# Altium schematic sheet 03_Sensors.SchDoc
size 406 x 279 mm
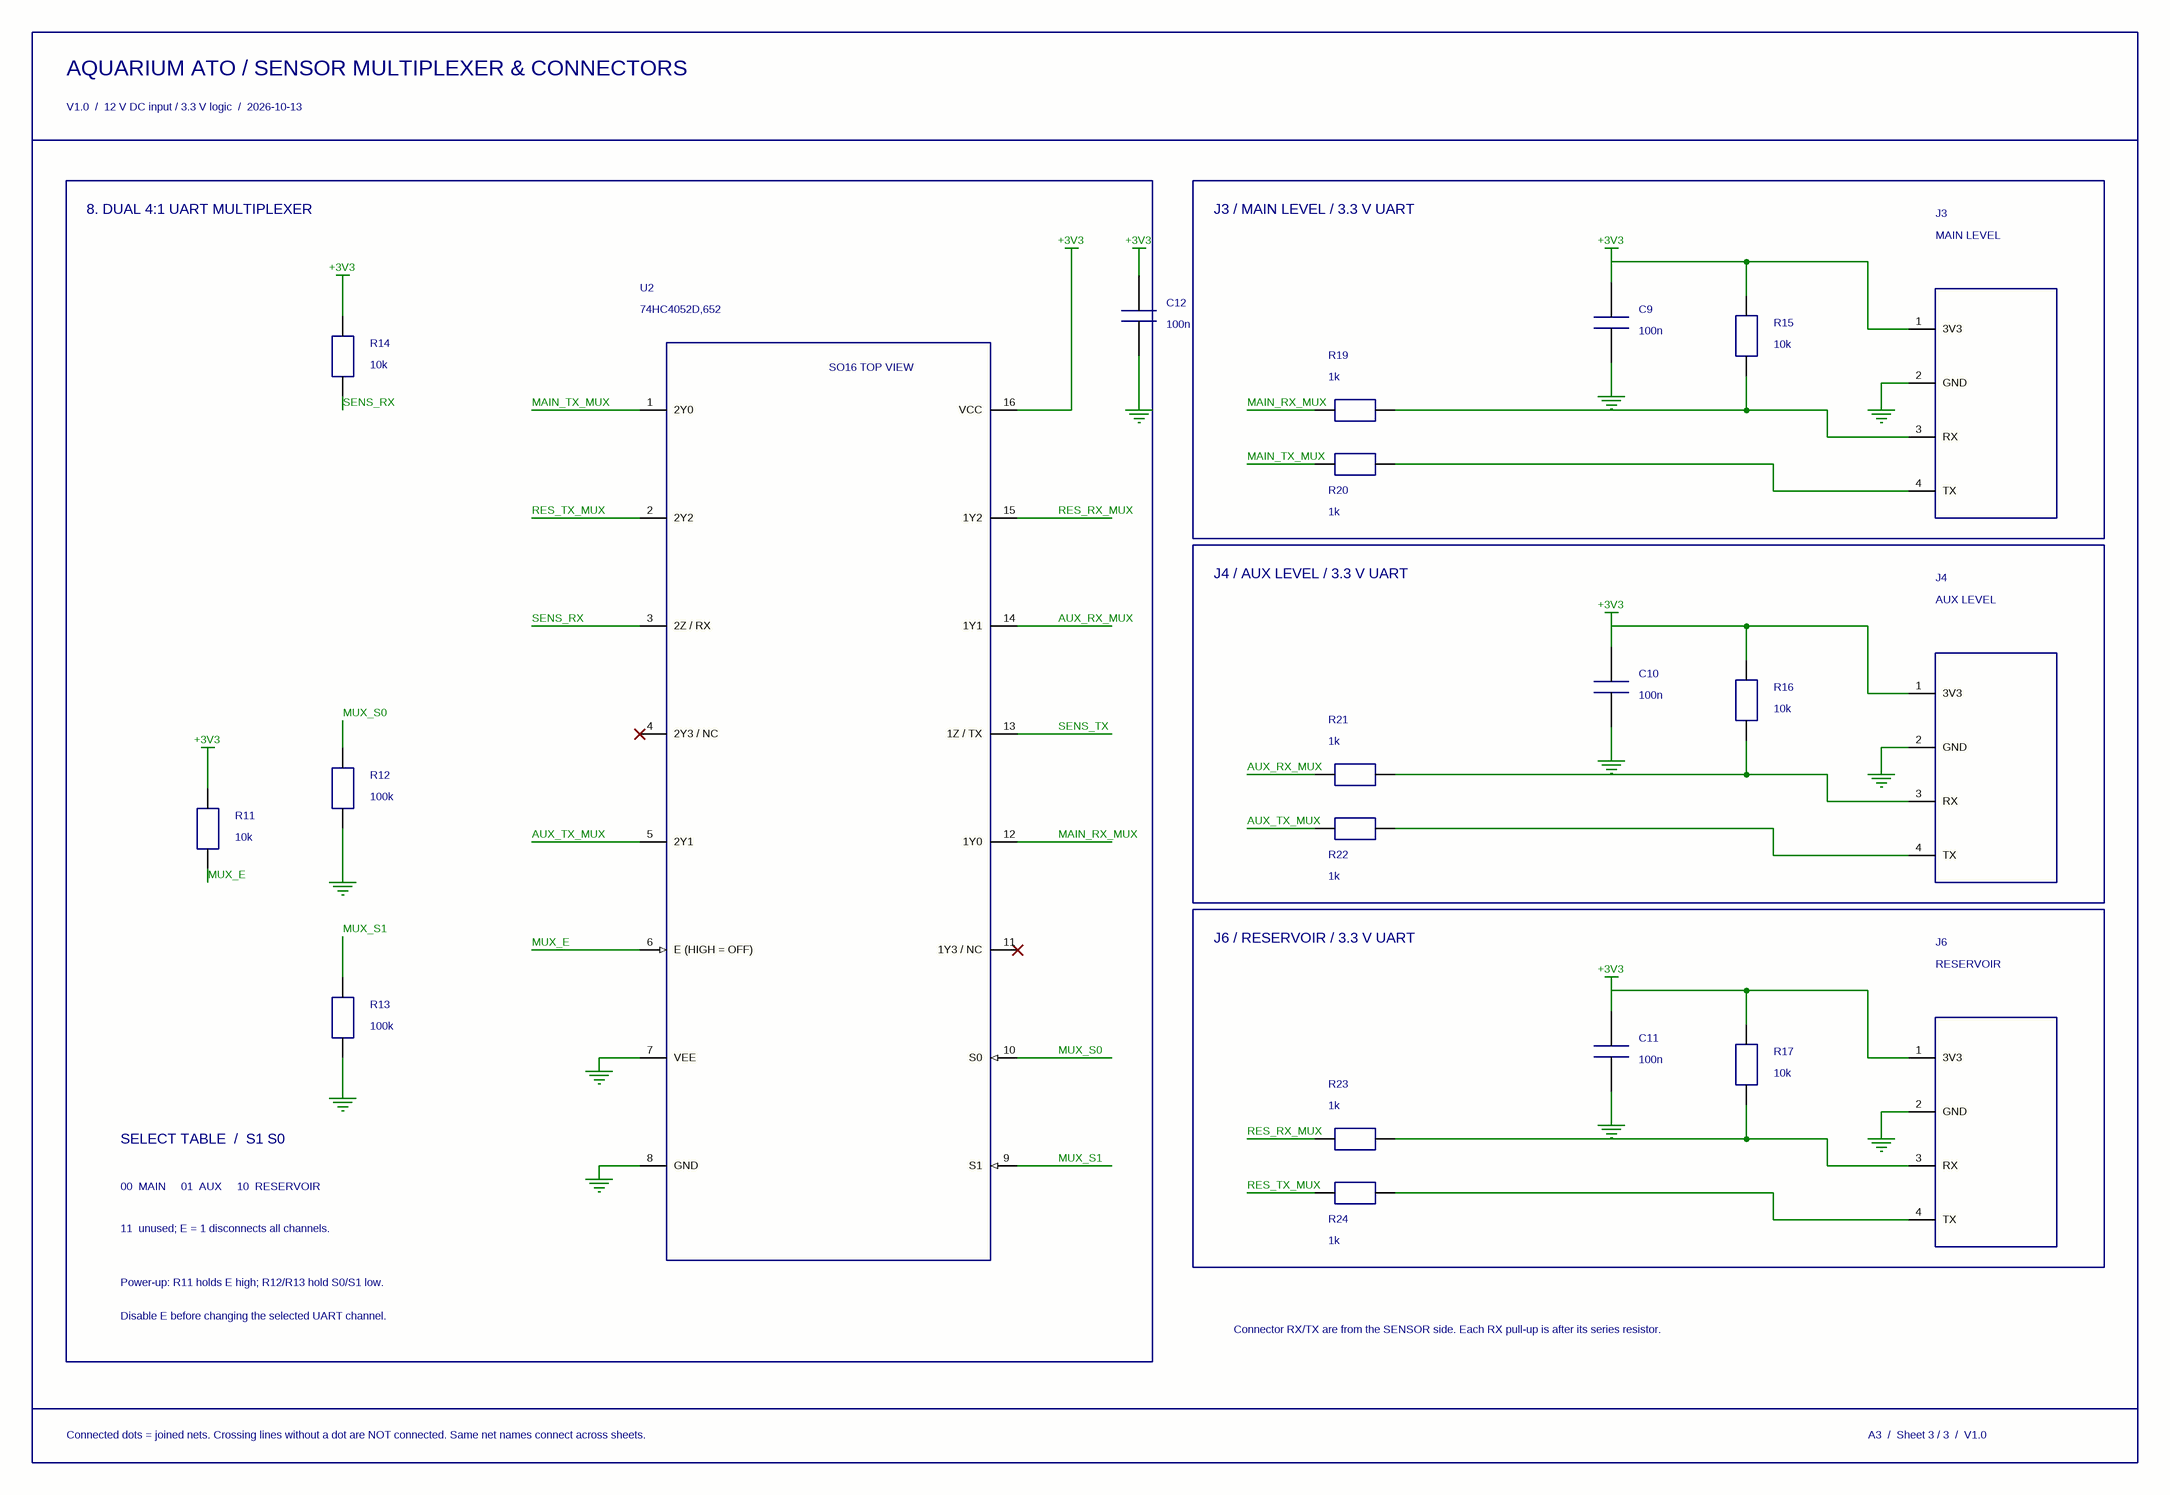
[diagram p0: 03_Sensors.SchDoc]

## Parts
C9  100n  [C_0603_1608Metric]
C10  100n  [C_0603_1608Metric]
C11  100n  [C_0603_1608Metric]
C12  100n  [C_0603_1608Metric]
J3  MAIN LEVEL  [HDR_1x4_P2.54]
J4  AUX LEVEL  [HDR_1x4_P2.54]
J6  RESERVOIR  [HDR_1x4_P2.54]
R11  10k  [R_0603_1608Metric]
R12  100k  [R_0603_1608Metric]
R13  100k  [R_0603_1608Metric]
R14  10k  [R_0603_1608Metric]
R15  10k  [R_0603_1608Metric]
R16  10k  [R_0603_1608Metric]
R17  10k  [R_0603_1608Metric]
R19  1k  [R_0603_1608Metric]
R20  1k  [R_0603_1608Metric]
R21  1k  [R_0603_1608Metric]
R22  1k  [R_0603_1608Metric]
R23  1k  [R_0603_1608Metric]
R24  1k  [R_0603_1608Metric]
U2  74HC4052D,652  [SOIC-16_P1.27]

## Blocks framed on the sheet
J3 / MAIN LEVEL / 3.3 V UART: C9 J3 R15 R19 R20
J4 / AUX LEVEL / 3.3 V UART: C10 J4 R16 R21 R22
J6 / RESERVOIR / 3.3 V UART: C11 J6 R17 R23 R24

## Nets
+3V3: C9.1 C10.1 C11.1 C12.1 J3.1(3V3) J4.1(3V3) J6.1(3V3) R11.1 R14.1 R15.1 R16.1 R17.1 U2.16(VCC)
GND: C9.2 C10.2 C11.2 C12.2 J3.2(GND) J4.2(GND) J6.2(GND) R12.2 R13.2 U2.7(VEE) U2.8(GND)
AUX_RX_MUX: R21.1 U2.14(1Y1)
AUX_TX_MUX: R22.1 U2.5(2Y1)
MAIN_RX_MUX: R19.1 U2.12(1Y0)
MAIN_TX_MUX: R20.1 U2.1(2Y0)
MUX_E: R11.2 U2.6(E_(HIGH_=_OFF))
MUX_S0: R12.1 U2.10(S0)
MUX_S1: R13.1 U2.9(S1)
RES_RX_MUX: R23.1 U2.15(1Y2)
RES_TX_MUX: R24.1 U2.2(2Y2)
SENS_RX: R14.2 U2.3(2Z_/_RX)
SENS_TX: U2.13(1Z_/_TX)
NetJ3_3: J3.3(RX) R15.2 R19.2
NetJ3_4: J3.4(TX) R20.2
NetJ4_3: J4.3(RX) R16.2 R21.2
NetJ4_4: J4.4(TX) R22.2
NetJ6_3: J6.3(RX) R17.2 R23.2
NetJ6_4: J6.4(TX) R24.2

Not connected (* = marked no-connect by the designer): U2 4(2Y3_/_NC)* 11(1Y3_/_NC)*

## Notes on the sheet
- AQUARIUM ATO / SENSOR MULTIPLEXER & CONNECTORS
- V1.0  /  12 V DC input / 3.3 V logic  /  2026-10-13
- 8. DUAL 4:1 UART MULTIPLEXER
- SELECT TABLE  /  S1 S0
- 00  MAIN     01  AUX     10  RESERVOIR
- 11  unused; E = 1 disconnects all channels.
- Power-up: R11 holds E high; R12/R13 hold S0/S1 low.
- Disable E before changing the selected UART channel.
- Connector RX/TX are from the SENSOR side. Each RX pull-up is after its series resistor.
- Connected dots = joined nets. Crossing lines without a dot are NOT connected. Same net names connect across sheets.
- A3  /  Sheet 3 / 3  /  V1.0
- (in symbol 74HC4052D) SO16 TOP VIEW

## Library data of the parts
C9-C12 = CAPACITOR_C_0603_1608METRIC: 100n; footprint C_0603_1608Metric
J3 = SENSOR_UART_4P: MAIN LEVEL; footprint HDR_1x4_P2.54
J4 = SENSOR_UART_4P: AUX LEVEL; footprint HDR_1x4_P2.54
J6 = SENSOR_UART_4P: RESERVOIR; footprint HDR_1x4_P2.54
R11 R14-R17 = RESISTOR_0603: 10k; footprint R_0603_1608Metric
R12 R13 = RESISTOR_0603: 100k; footprint R_0603_1608Metric
R19-R24 = RESISTOR_0603: 1k; footprint R_0603_1608Metric
U2 = 74HC4052D: 74HC4052D,652; package SO16 (SOT109-1); footprint SOIC-16_P1.27